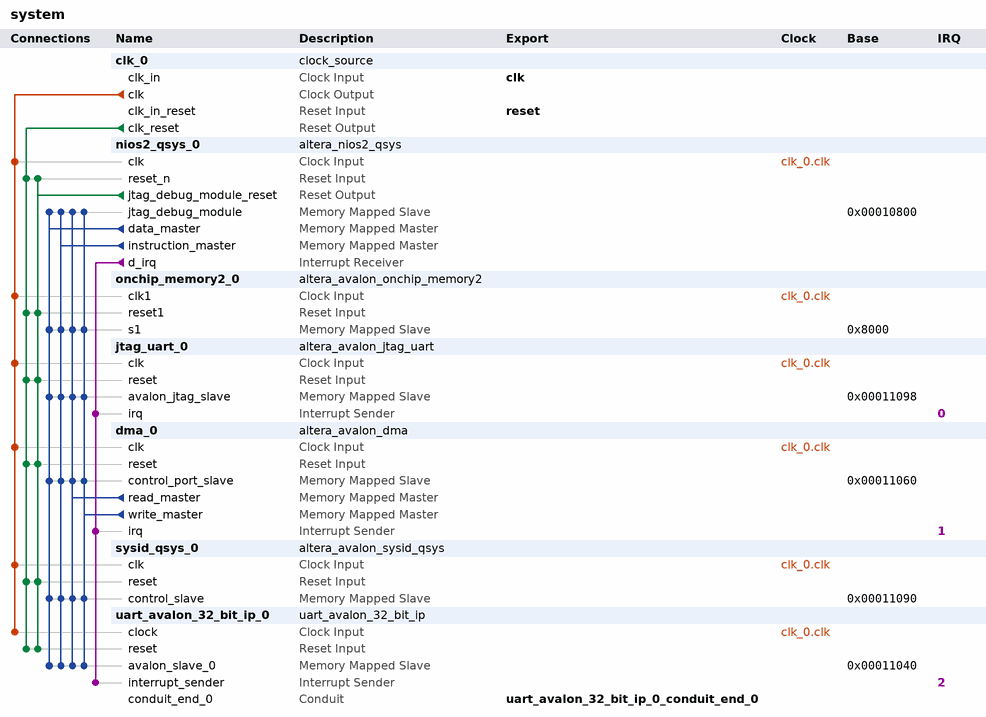
[diagram p0: system contents]
# Platform Designer (Qsys) system system, Cyclone II EP2C35F672C6
# Parameters at their usual value, and those the tool derives, are not listed.
package require -exact qsys 13.0
create_system system
set_project_property DEVICE_FAMILY {Cyclone II}
set_project_property DEVICE EP2C35F672C6

add_instance clk_0 clock_source 13.0
set_instance_parameter_value clk_0 clockFrequency 50000000

add_instance nios2_qsys_0 altera_nios2_qsys 13.0
set_instance_parameter_value nios2_qsys_0 resetSlave onchip_memory2_0.s1
set_instance_parameter_value nios2_qsys_0 mmu_TLBMissExcSlave None
set_instance_parameter_value nios2_qsys_0 exceptionSlave onchip_memory2_0.s1
set_instance_parameter_value nios2_qsys_0 breakSlave nios2_qsys_0.jtag_debug_module
set_instance_parameter_value nios2_qsys_0 impl Fast
set_instance_parameter_value nios2_qsys_0 icache_size 4096

add_instance onchip_memory2_0 altera_avalon_onchip_memory2 13.0.1.99.2
set_instance_parameter_value onchip_memory2_0 dataWidth 32
set_instance_parameter_value onchip_memory2_0 dualPort false
set_instance_parameter_value onchip_memory2_0 initMemContent true
set_instance_parameter_value onchip_memory2_0 initializationFileName onchip_mem.hex
set_instance_parameter_value onchip_memory2_0 memorySize 32768

add_instance jtag_uart_0 altera_avalon_jtag_uart 13.0.1.99.2
set_instance_parameter_value jtag_uart_0 simInteractiveOptions NO_INTERACTIVE_WINDOWS

add_instance dma_0 altera_avalon_dma 13.0.1.99.2
set_instance_parameter_value dma_0 allowByteTransactions true
set_instance_parameter_value dma_0 allowDoubleWordTransactions true
set_instance_parameter_value dma_0 allowHalfWordTransactions true
set_instance_parameter_value dma_0 allowQuadWordTransactions true
set_instance_parameter_value dma_0 burstEnable false
set_instance_parameter_value dma_0 fifoDepth 32
set_instance_parameter_value dma_0 maxBurstSize 128
set_instance_parameter_value dma_0 minimumDmaTransactionRegisterWidth 13

add_instance sysid_qsys_0 altera_avalon_sysid_qsys 13.0
set_instance_parameter_value sysid_qsys_0 id 0

add_instance uart_avalon_32_bit_ip_0 uart_avalon_32_bit_ip 1.0

# connections
add_connection clk_0.clk dma_0.clk clock
add_connection clk_0.clk jtag_uart_0.clk clock
add_connection clk_0.clk nios2_qsys_0.clk clock
add_connection clk_0.clk onchip_memory2_0.clk1 clock
add_connection clk_0.clk sysid_qsys_0.clk clock
add_connection clk_0.clk uart_avalon_32_bit_ip_0.clock clock
add_connection clk_0.clk_reset dma_0.reset reset
add_connection clk_0.clk_reset jtag_uart_0.reset reset
add_connection clk_0.clk_reset nios2_qsys_0.reset_n reset
add_connection clk_0.clk_reset onchip_memory2_0.reset1 reset
add_connection clk_0.clk_reset sysid_qsys_0.reset reset
add_connection clk_0.clk_reset uart_avalon_32_bit_ip_0.reset reset
add_connection nios2_qsys_0.jtag_debug_module_reset dma_0.reset reset
add_connection nios2_qsys_0.jtag_debug_module_reset jtag_uart_0.reset reset
add_connection nios2_qsys_0.jtag_debug_module_reset nios2_qsys_0.reset_n reset
add_connection nios2_qsys_0.jtag_debug_module_reset onchip_memory2_0.reset1 reset
add_connection nios2_qsys_0.jtag_debug_module_reset sysid_qsys_0.reset reset
add_connection nios2_qsys_0.jtag_debug_module_reset uart_avalon_32_bit_ip_0.reset reset
add_connection dma_0.read_master dma_0.control_port_slave avalon
set_connection_parameter_value dma_0.read_master/dma_0.control_port_slave baseAddress 0x00011060
add_connection dma_0.read_master jtag_uart_0.avalon_jtag_slave avalon
set_connection_parameter_value dma_0.read_master/jtag_uart_0.avalon_jtag_slave baseAddress 0x00011098
add_connection dma_0.read_master nios2_qsys_0.jtag_debug_module avalon
set_connection_parameter_value dma_0.read_master/nios2_qsys_0.jtag_debug_module baseAddress 0x00010800
add_connection dma_0.read_master onchip_memory2_0.s1 avalon
set_connection_parameter_value dma_0.read_master/onchip_memory2_0.s1 baseAddress 0x8000
add_connection dma_0.read_master sysid_qsys_0.control_slave avalon
set_connection_parameter_value dma_0.read_master/sysid_qsys_0.control_slave baseAddress 0x00011090
add_connection dma_0.read_master uart_avalon_32_bit_ip_0.avalon_slave_0 avalon
set_connection_parameter_value dma_0.read_master/uart_avalon_32_bit_ip_0.avalon_slave_0 baseAddress 0x00011040
add_connection dma_0.write_master dma_0.control_port_slave avalon
set_connection_parameter_value dma_0.write_master/dma_0.control_port_slave baseAddress 0x00011060
add_connection dma_0.write_master jtag_uart_0.avalon_jtag_slave avalon
set_connection_parameter_value dma_0.write_master/jtag_uart_0.avalon_jtag_slave baseAddress 0x00011098
add_connection dma_0.write_master nios2_qsys_0.jtag_debug_module avalon
set_connection_parameter_value dma_0.write_master/nios2_qsys_0.jtag_debug_module baseAddress 0x00010800
add_connection dma_0.write_master onchip_memory2_0.s1 avalon
set_connection_parameter_value dma_0.write_master/onchip_memory2_0.s1 baseAddress 0x8000
add_connection dma_0.write_master sysid_qsys_0.control_slave avalon
set_connection_parameter_value dma_0.write_master/sysid_qsys_0.control_slave baseAddress 0x00011090
add_connection dma_0.write_master uart_avalon_32_bit_ip_0.avalon_slave_0 avalon
set_connection_parameter_value dma_0.write_master/uart_avalon_32_bit_ip_0.avalon_slave_0 baseAddress 0x00011040
add_connection nios2_qsys_0.data_master dma_0.control_port_slave avalon
set_connection_parameter_value nios2_qsys_0.data_master/dma_0.control_port_slave baseAddress 0x00011060
add_connection nios2_qsys_0.data_master jtag_uart_0.avalon_jtag_slave avalon
set_connection_parameter_value nios2_qsys_0.data_master/jtag_uart_0.avalon_jtag_slave baseAddress 0x00011098
add_connection nios2_qsys_0.data_master nios2_qsys_0.jtag_debug_module avalon
set_connection_parameter_value nios2_qsys_0.data_master/nios2_qsys_0.jtag_debug_module baseAddress 0x00010800
add_connection nios2_qsys_0.data_master onchip_memory2_0.s1 avalon
set_connection_parameter_value nios2_qsys_0.data_master/onchip_memory2_0.s1 baseAddress 0x8000
add_connection nios2_qsys_0.data_master sysid_qsys_0.control_slave avalon
set_connection_parameter_value nios2_qsys_0.data_master/sysid_qsys_0.control_slave baseAddress 0x00011090
add_connection nios2_qsys_0.data_master uart_avalon_32_bit_ip_0.avalon_slave_0 avalon
set_connection_parameter_value nios2_qsys_0.data_master/uart_avalon_32_bit_ip_0.avalon_slave_0 baseAddress 0x00011040
add_connection nios2_qsys_0.instruction_master dma_0.control_port_slave avalon
set_connection_parameter_value nios2_qsys_0.instruction_master/dma_0.control_port_slave baseAddress 0x00011060
add_connection nios2_qsys_0.instruction_master jtag_uart_0.avalon_jtag_slave avalon
set_connection_parameter_value nios2_qsys_0.instruction_master/jtag_uart_0.avalon_jtag_slave baseAddress 0x00011098
add_connection nios2_qsys_0.instruction_master nios2_qsys_0.jtag_debug_module avalon
set_connection_parameter_value nios2_qsys_0.instruction_master/nios2_qsys_0.jtag_debug_module baseAddress 0x00010800
add_connection nios2_qsys_0.instruction_master onchip_memory2_0.s1 avalon
set_connection_parameter_value nios2_qsys_0.instruction_master/onchip_memory2_0.s1 baseAddress 0x8000
add_connection nios2_qsys_0.instruction_master sysid_qsys_0.control_slave avalon
set_connection_parameter_value nios2_qsys_0.instruction_master/sysid_qsys_0.control_slave baseAddress 0x00011090
add_connection nios2_qsys_0.instruction_master uart_avalon_32_bit_ip_0.avalon_slave_0 avalon
set_connection_parameter_value nios2_qsys_0.instruction_master/uart_avalon_32_bit_ip_0.avalon_slave_0 baseAddress 0x00011040
add_connection nios2_qsys_0.d_irq dma_0.irq interrupt
set_connection_parameter_value nios2_qsys_0.d_irq/dma_0.irq irqNumber 1
add_connection nios2_qsys_0.d_irq jtag_uart_0.irq interrupt
set_connection_parameter_value nios2_qsys_0.d_irq/jtag_uart_0.irq irqNumber 0
add_connection nios2_qsys_0.d_irq uart_avalon_32_bit_ip_0.interrupt_sender interrupt
set_connection_parameter_value nios2_qsys_0.d_irq/uart_avalon_32_bit_ip_0.interrupt_sender irqNumber 2

# exported interfaces
add_interface clk clock sink
set_interface_property clk EXPORT_OF clk_0.clk_in
add_interface reset reset sink
set_interface_property reset EXPORT_OF clk_0.clk_in_reset
add_interface uart_avalon_32_bit_ip_0_conduit_end_0 conduit end
set_interface_property uart_avalon_32_bit_ip_0_conduit_end_0 EXPORT_OF uart_avalon_32_bit_ip_0.conduit_end_0

set_interconnect_requirement {$system} qsys_mm.clockCrossingAdapter HANDSHAKE
set_interconnect_requirement {$system} qsys_mm.maxAdditionalLatency 1

save_system system.qsys
